# Altium project Battery_HAT.PrjPcb
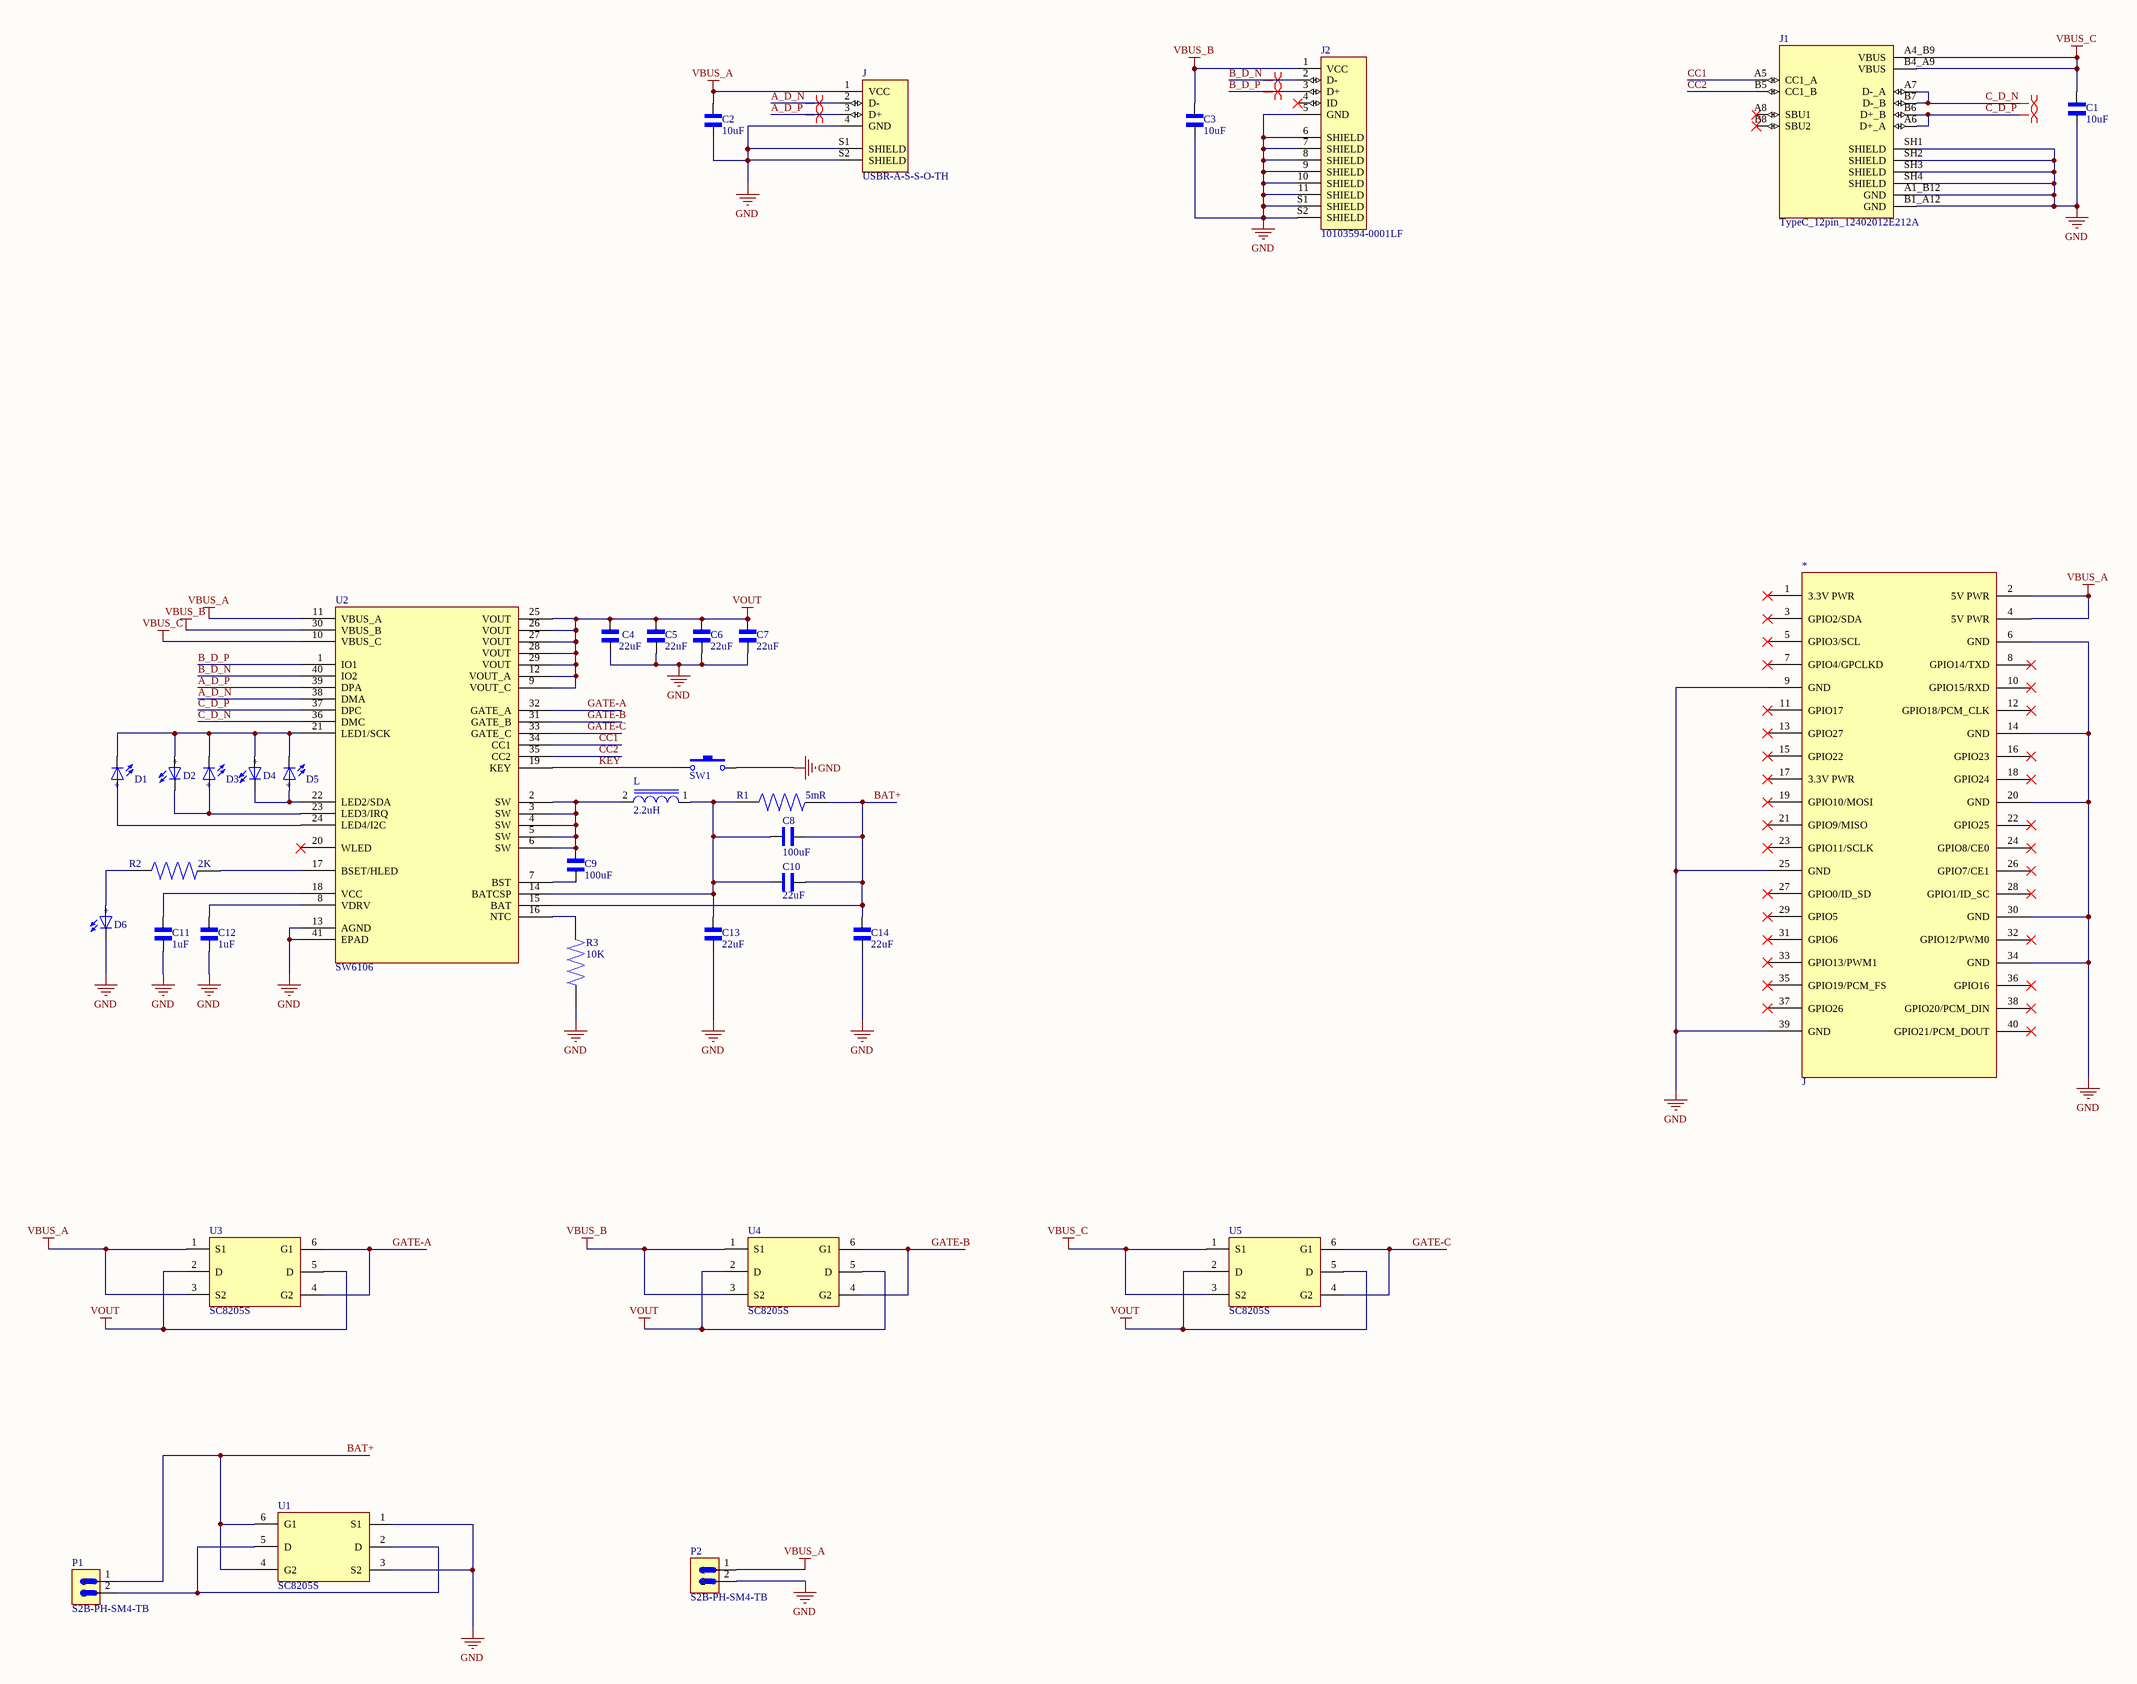
[diagram p0: main.SchDoc]
1 sheet, 36 parts. Net scope: global (net labels, ports and power ports of the same name join across sheets).
Board file: PCB.PcbDoc

## Sheet main.SchDoc
size D; SheetNumber: 1; SheetTotal: 1

### Parts
*  J  [GPIO_INTERFACE]
C1  10uF  [CAPC1608X94N]
C2  10uF  [CAPC1608X94N]
C3  10uF  [CAPC1608X94N]
C4  22uF  [CAPC1608X94N]
C5  22uF  [CAPC1608X94N]
C6  22uF  [CAPC1608X94N]
C7  22uF  [CAPC1608X94N]
C8  100uF  [CAPC1608X94N]
C9  100uF  [CAPC1608X94N]
C10  22uF  [CAPC1608X94N]
C11  1uF  [CAPC1608X94N]
C12  1uF  [CAPC1608X94N]
C13  22uF  [CAPC1608X94N]
C14  22uF  [CAPC1608X94N]
D1  WL-SMCW_1206  [WL-SMCW_1206]  (value not drawn)
D2  WL-SMCW_1206  [WL-SMCW_1206]  (value not drawn)
D3  WL-SMCW_1206  [WL-SMCW_1206]  (value not drawn)
D4  WL-SMCW_1206  [WL-SMCW_1206]  (value not drawn)
D5  WL-SMCW_1206  [WL-SMCW_1206]  (value not drawn)
D6  WL-SMCW_1206  [WL-SMCW_1206]  (value not drawn)
J  USBR-A-S-S-O-TH  [SAMTEC_USBR-A-S-S-O-TH]
J1  TypeC_12pin_12402012E212A  [TypeC_12pin_12402012E212A]
J2  10103594-0001LF  [AMPHENOL_10103594-0001LF]
L  2.2uH  [Introdutor_47uH_12x12x7]
P1  S2B-PH-SM4-TB  [JST_S2B-PH-SM4-TB]
P2  S2B-PH-SM4-TB  [JST_S2B-PH-SM4-TB]
R1  5mR  [RES_ERJB1CFR015U]
R2  2K  [RES_ERJU03J474V]
R3  10K  [RES_ERJU03J474V]
SW1  Nut Nhan 2 Chan SMD 3x6x2.5  [PCBComponent_1]  (value not drawn)
U1  SC8205S  [IC_SN6505ADBVR]
U2  SW6106  [QFN50P600X600X80-41N]
U3  SC8205S  [IC_SN6505ADBVR]
U4  SC8205S  [IC_SN6505ADBVR]
U5  SC8205S  [IC_SN6505ADBVR]

### Nets
GND: *.6(GND) *.9(GND) *.14(GND) *.20(GND) *.25(GND) *.30(GND) *.34(GND) *.39(GND) C1.1 C2.1 C3.1 C4.1 C5.1 C6.1 C7.1 C11.1 C12.1 C13.2 C14.2 D6.1(NEG) J.4(GND) J.S1(SHIELD) J.S2(SHIELD) J1.A1_B12(GND) J1.B1_A12(GND) J1.SH1(SHIELD) J1.SH2(SHIELD) J1.SH3(SHIELD) J1.SH4(SHIELD) J2.5(GND) J2.6(SHIELD) J2.7(SHIELD) J2.8(SHIELD) J2.9(SHIELD) J2.10(SHIELD) J2.11(SHIELD) J2.S1(SHIELD) J2.S2(SHIELD) P2.2 R3.1 SW1.2 U1.1(S1) U1.3(S2) U2.13(AGND) U2.41(EPAD)
VBUS_A: *.2(5V_PWR) *.4(5V_PWR) C2.2 J.1(VCC) P2.1 U2.11(VBUS_A) U3.1(S1) U3.3(S2)
VBUS_B: C3.2 J2.1(VCC) U2.30(VBUS_B) U4.1(S1) U4.3(S2)
VBUS_C: C1.2 J1.A4_B9(VBUS) J1.B4_A9(VBUS) U2.10(VBUS_C) U5.1(S1) U5.3(S2)
VOUT: C4.2 C5.2 C6.2 C7.2 U2.9(VOUT_C) U2.12(VOUT_A) U2.25(VOUT) U2.26(VOUT) U2.27(VOUT) U2.28(VOUT) U2.29(VOUT) U3.2(D) U3.5(D) U4.2(D) U4.5(D) U5.2(D) U5.5(D)
A_D_N: J.2(D-) U2.38(DMA)
A_D_P: J.3(D+) U2.39(DPA)
B_D_N: J2.2(D-) U2.40(IO2)
B_D_P: J2.3(D+) U2.1(IO1)
BAT+: C8.1 C10.1 C14.1 P1.1 R1.2 U1.4(G2) U1.6(G1) U2.15(BAT)
C_D_N: J1.A7(D-_A) J1.B7(D-_B) U2.36(DMC)
C_D_P: J1.A6(D+_A) J1.B6(D+_B) U2.37(DPC)
CC1: J1.A5(CC1_A) U2.34(CC1)
CC2: J1.B5(CC1_B) U2.35(CC2)
GATE-A: U2.32(GATE_A) U3.4(G2) U3.6(G1)
GATE-B: U2.31(GATE_B) U4.4(G2) U4.6(G1)
GATE-C: U2.33(GATE_C) U5.4(G2) U5.6(G1)
KEY: SW1.1 U2.19(KEY)
NetC8_2: C8.2 C10.2 C13.1 L.1 R1.1 U2.14(BATCSP)
NetC9_1: C9.1 U2.7(BST)
NetC9_2: C9.2 L.2 U2.2(SW) U2.3(SW) U2.4(SW) U2.5(SW) U2.6(SW)
NetC11_2: C11.2 U2.18(VCC)
NetC12_2: C12.2 U2.8(VDRV)
NetD1_1: D1.1(NEG) D2.2(POS) D3.1(NEG) D4.2(POS) D5.1(NEG) U2.21(LED1/SCK)
NetD1_2: D1.2(POS) U2.24(LED4/I2C)
NetD2_1: D2.1(NEG) D3.2(POS) U2.23(LED3/IRQ)
NetD4_1: D4.1(NEG) D5.2(POS) U2.22(LED2/SDA)
NetD6_2: D6.2(POS) R2.1
NetP1_2: P1.2 U1.2(D) U1.5(D)
NetR2_2: R2.2 U2.17(BSET/HLED)
NetR3_2: R3.2 U2.16(NTC)

Not connected (* = marked no-connect by the designer): * 1(3.3V_PWR)* 3(GPIO2/SDA)* 5(GPIO3/SCL)* 7(GPIO4/GPCLKD)* 8(GPIO14/TXD)* 10(GPIO15/RXD)* 11(GPIO17)* 12(GPIO18/PCM_CLK)* 13(GPIO27)* 15(GPIO22)* 16(GPIO23)* 17(3.3V_PWR)* 18(GPIO24)* 19(GPIO10/MOSI)* 21(GPIO9/MISO)* 22(GPIO25)* 23(GPIO11/SCLK)* 24(GPIO8/CE0)* 26(GPIO7/CE1)* 27(GPIO0/ID_SD)* 28(GPIO1/ID_SC)* 29(GPIO5)* 31(GPIO6)* 32(GPIO12/PWM0)* 33(GPIO13/PWM1)* 35(GPIO19/PCM_FS)* 36(GPIO16)* 37(GPIO26)* 38(GPIO20/PCM_DIN)* 40(GPIO21/PCM_DOUT)*; J1 A8(SBU1)* B8(SBU2)*; J2 4(ID)*; U2 20(WLED)*

### Layout directives
differential pair: A_D_N, A_D_P, B_D_N, B_D_P, C_D_N, C_D_P

### Notes on the sheet
- (in symbol WL-SMCW_1206) +

### Library data of the parts
* = RASPBERRY_INTERFACE
C1-C14 = cap_0603_VJ0603D3R9DXCAP: cap 0603 (1608 Metric); MF: Vishay Vitramon; SnapEDA_Link: https://www.snapeda.com/parts/VJ0603D3R9DXCAP/Vishay/view-part/?ref=snap; Package: 1608 Vishay Vitramon; Value: *; MP: VJ0603D3R9DXCAP; Check_prices: https://www.snapeda.com/parts/VJ0603D3R9DXCAP/Vishay/view-part/?ref=eda
D1-D6 = WL-SMCW_1206: 1206, Blue Typ.(@20mA): 470nm, 145mcd, 3.2V, 140Â° InGaN; MF: Wurth Electronics; MP: 150120BS75000; SnapEDA_Link: https://www.snapeda.com/parts/150120BS75000/Wurth+Electronics/view-part/?ref=snap; Package: 1206 Wurth Electronics; Value: *; Check_prices: https://www.snapeda.com/parts/150120BS75000/Wurth+Electronics/view-part/?ref=eda
J = USBR-A-S-S-O-TH: USB-A _USB TYPE-A_ USB 2.0 Receptacle Connector 4 Position Through Hole, Right Angle; MF: Samtec; SnapEDA_Link: https://www.snapeda.com/parts/USBR-A-S-S-O-TH/Samtec%20Inc./view-part/279681/?ref=snap; Availability: Unavailable; Price: None; Package: None; MP: USBR-A-S-S-O-TH; Value: *
J1 = TypeC_12pin_12402012E212A: USB2.0, Type C, Top mount, CH 1.68mm, Dual Row SMT; MF: Amphenol ICC (Commercial Products); MP: 12402012E212A; Price: None; Package: None; Availability: In Stock; SnapEDA_Link: https://www.snapeda.com/parts/12402012E212A/Amphenol/view-part/?ref=snap; Value: *; Check_prices: https://www.snapeda.com/parts/12402012E212A/Amphenol/view-part/?ref=eda; Purchase-URL: https://pricing.snapeda.com/search/part/12402012E212A/?ref=eda
J2 = 10103594-0001LF: USB - micro B USB 2.0 Receptacle Connector 5 Position Surface Mount, Right Angle; Through Hole; MF: {'manufacturer': u'Amphenol ICC (FCI)'}; Package: None; Price: None; Value: *; MP: 10103594-0001LF; Availability: Unavailable
L = Introdutor_47uH_12x12x7SRR1260-470M: SMD CDRH127 1280-220 22uH 6.3A; MF: Bourns; Value: *; Package: Nonstandard Bourns; Price: None; SnapEDA_Link: https://www.snapeda.com/parts/SRR1260-470M/Bourns/view-part/283129/?ref=snap; Availability: Unavailable; MP: SRR1260-470M
P1 P2 = S2B-PH-SM4-TB: Connector Header Surface Mount, Right Angle 2 position 0.079 (2.00mm); MF: JST Sales; SnapEDA_Link: https://www.snapeda.com/parts/S2B-PH-SM4-TB/JST/view-part/?ref=snap; Package: None; Value: *; MP: S2B-PH-SM4-TB; Check_prices: https://www.snapeda.com/parts/S2B-PH-SM4-TB/JST/view-part/?ref=eda
R1 = res_2512_ERJB1CFR015U: RES 2512; Price: None; Value: *; Package: None; Availability: Unavailable; MP: ERJB1CFR015U
R2 R3 = res_0603_ERJU03J474V: 0603 Anti-Sulfurated; MF: Panasonic; SnapEDA_Link: https://www.snapeda.com/parts/ERJU03J474V/Panasonic/view-part/?ref=snap; Package: 1608-2 Panasonic; Value: *; MP: ERJU03J474V; Check_prices: https://www.snapeda.com/parts/ERJU03J474V/Panasonic/view-part/?ref=eda
SW1 = Nut Nhan 2 Chan SMD 3x6x2.5: Ma_Hang: MH001036; Ten: Nút Nhấn 2 Chân 3x6x2.5MM SMD
U1 U3-U5 = SC8205S: SC8205S – Dual N-Channel Enhancement Mode Power MOSFET, SOT-23-6 Package.; MF: Texas Instruments; MP: SN6505ADBVR; SnapEDA_Link: https://www.snapeda.com/parts/SN6505ADBVR/Texas+Instruments/view-part/?ref=snap; Package: SOT-23-6 Texas Instruments; Value: *; Check_prices: https://www.snapeda.com/parts/SN6505ADBVR/Texas+Instruments/view-part/?ref=eda
U2 = SW6106: SW6106 – Bidirectional Fast Charging Power Bank Management IC, 5V Output, QFN-40, 6×6mm.